# Altium project 01_Riona_Leka_Intro_Task_PCB.PrjPcb
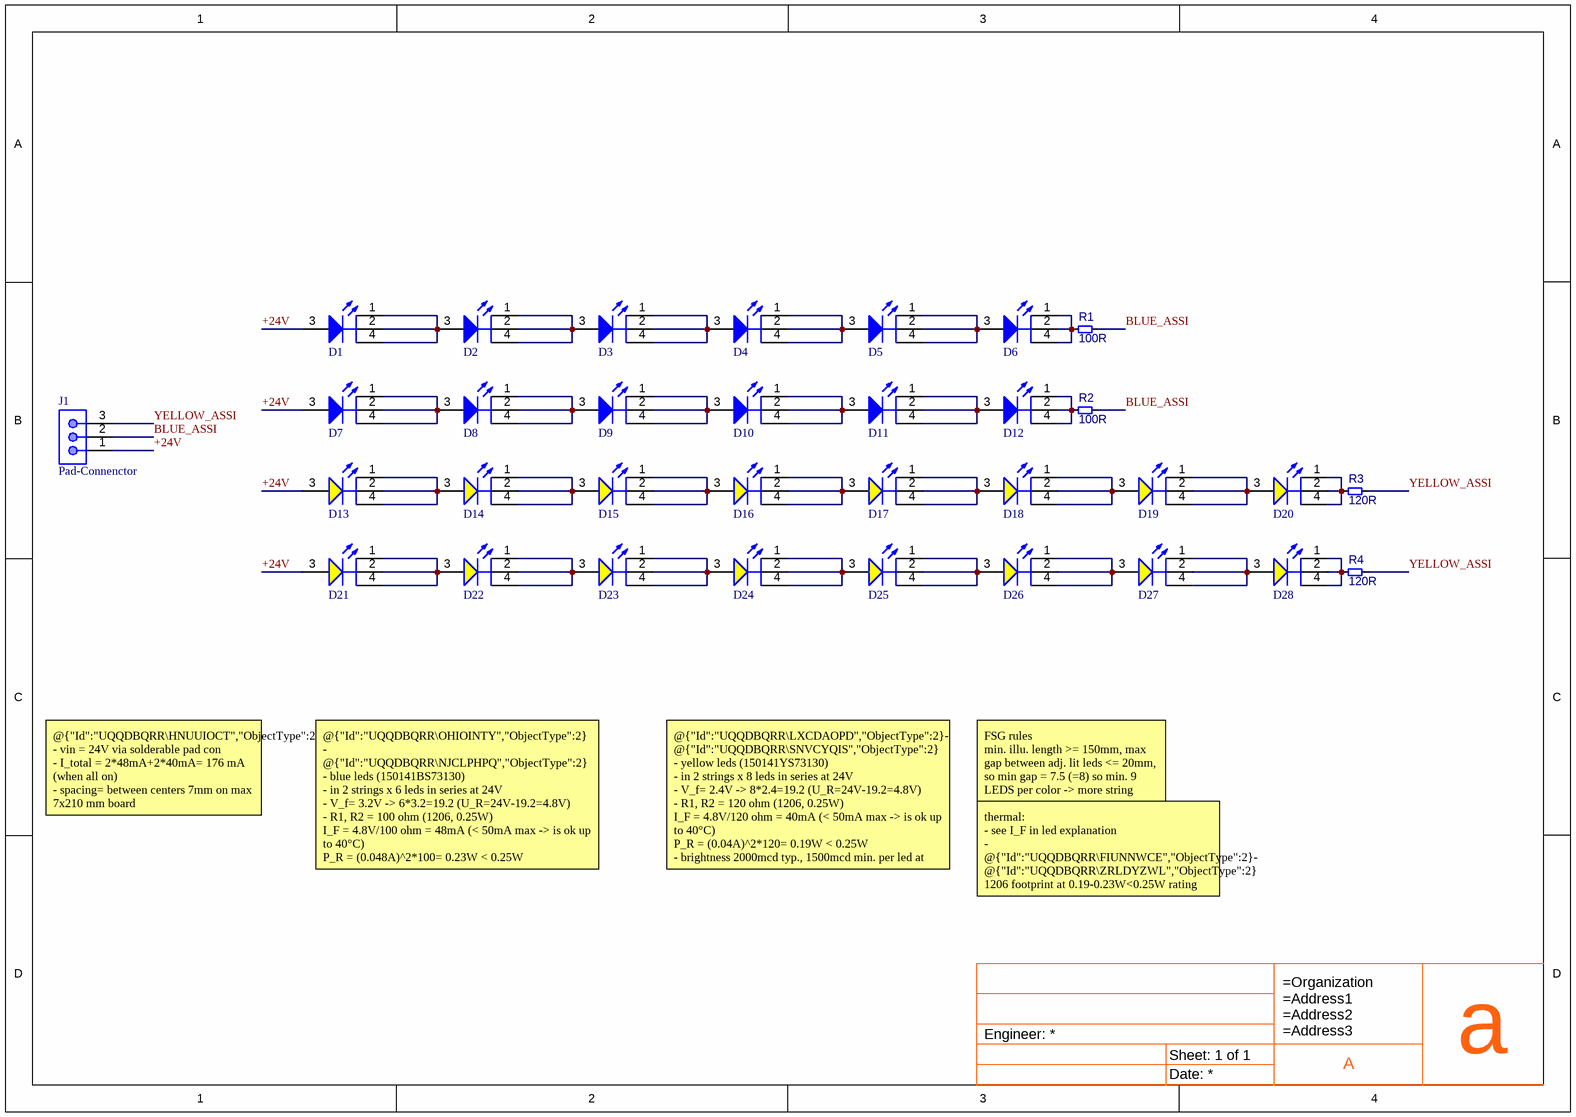
[diagram p0: LED_Strip_RL.SchDoc]
1 sheet, 33 parts. Net scope: global (net labels, ports and power ports of the same name join across sheets).
Board file: LED_Strip_RL.PcbDoc

## Sheet LED_Strip_RL.SchDoc
size 294 x 208 mm; SheetNumber: 1; SheetTotal: 1

### Parts
D1  Blue, 3.2V, 120°  [WL-SMTW_3528_LPCC 4]  (value not drawn)
D2  Blue, 3.2V, 120°  [WL-SMTW_3528_LPCC 4]  (value not drawn)
D3  Blue, 3.2V, 120°  [WL-SMTW_3528_LPCC 4]  (value not drawn)
D4  Blue, 3.2V, 120°  [WL-SMTW_3528_LPCC 4]  (value not drawn)
D5  Blue, 3.2V, 120°  [WL-SMTW_3528_LPCC 4]  (value not drawn)
D6  Blue, 3.2V, 120°  [WL-SMTW_3528_LPCC 4]  (value not drawn)
D7  Blue, 3.2V, 120°  [WL-SMTW_3528_LPCC 4]  (value not drawn)
D8  Blue, 3.2V, 120°  [WL-SMTW_3528_LPCC 4]  (value not drawn)
D9  Blue, 3.2V, 120°  [WL-SMTW_3528_LPCC 4]  (value not drawn)
D10  Blue, 3.2V, 120°  [WL-SMTW_3528_LPCC 4]  (value not drawn)
D11  Blue, 3.2V, 120°  [WL-SMTW_3528_LPCC 4]  (value not drawn)
D12  Blue, 3.2V, 120°  [WL-SMTW_3528_LPCC 4]  (value not drawn)
D13  Yellow, 2.4V, 120°  [WL-SMTW_3528_LPCC 4]  (value not drawn)
D14  Yellow, 2.4V, 120°  [WL-SMTW_3528_LPCC 4]  (value not drawn)
D15  Yellow, 2.4V, 120°  [WL-SMTW_3528_LPCC 4]  (value not drawn)
D16  Yellow, 2.4V, 120°  [WL-SMTW_3528_LPCC 4]  (value not drawn)
D17  Yellow, 2.4V, 120°  [WL-SMTW_3528_LPCC 4]  (value not drawn)
D18  Yellow, 2.4V, 120°  [WL-SMTW_3528_LPCC 4]  (value not drawn)
D19  Yellow, 2.4V, 120°  [WL-SMTW_3528_LPCC 4]  (value not drawn)
D20  Yellow, 2.4V, 120°  [WL-SMTW_3528_LPCC 4]  (value not drawn)
D21  Yellow, 2.4V, 120°  [WL-SMTW_3528_LPCC 4]  (value not drawn)
D22  Yellow, 2.4V, 120°  [WL-SMTW_3528_LPCC 4]  (value not drawn)
D23  Yellow, 2.4V, 120°  [WL-SMTW_3528_LPCC 4]  (value not drawn)
D24  Yellow, 2.4V, 120°  [WL-SMTW_3528_LPCC 4]  (value not drawn)
D25  Yellow, 2.4V, 120°  [WL-SMTW_3528_LPCC 4]  (value not drawn)
D26  Yellow, 2.4V, 120°  [WL-SMTW_3528_LPCC 4]  (value not drawn)
D27  Yellow, 2.4V, 120°  [WL-SMTW_3528_LPCC 4]  (value not drawn)
D28  Yellow, 2.4V, 120°  [WL-SMTW_3528_LPCC 4]  (value not drawn)
J1  Pad-Connenctor  [TSAL-L Connector]
R1  Resistance: 100R  [1206(3216)_L]  (hidden comment: Resistor)
R2  Resistance: 100R  [1206(3216)_L]  (hidden comment: Resistor)
R3  Resistance: 120R  [1206(3216)_L]  (hidden comment: Resistor)
R4  Resistance: 120R  [1206(3216)_L]  (hidden comment: Resistor)

### Nets
+24V: D1.3(A) D7.3(A) D13.3(A) D21.3(A) J1.1
BLUE_ASSI: J1.2 R1.2 R2.2
YELLOW_ASSI: J1.3 R3.2 R4.2
NetD1_1: D1.1(K) D1.2(K) D1.4(K) D2.3(A)
NetD2_1: D2.1(K) D2.2(K) D2.4(K) D3.3(A)
NetD3_1: D3.1(K) D3.2(K) D3.4(K) D4.3(A)
NetD4_1: D4.1(K) D4.2(K) D4.4(K) D5.3(A)
NetD5_1: D5.1(K) D5.2(K) D5.4(K) D6.3(A)
NetD6_1: D6.1(K) D6.2(K) D6.4(K) R1.1
NetD7_1: D7.1(K) D7.2(K) D7.4(K) D8.3(A)
NetD8_1: D8.1(K) D8.2(K) D8.4(K) D9.3(A)
NetD9_1: D9.1(K) D9.2(K) D9.4(K) D10.3(A)
NetD10_1: D10.1(K) D10.2(K) D10.4(K) D11.3(A)
NetD11_1: D11.1(K) D11.2(K) D11.4(K) D12.3(A)
NetD12_1: D12.1(K) D12.2(K) D12.4(K) R2.1
NetD13_1: D13.1(K) D13.2(K) D13.4(K) D14.3(A)
NetD14_1: D14.1(K) D14.2(K) D14.4(K) D15.3(A)
NetD15_1: D15.1(K) D15.2(K) D15.4(K) D16.3(A)
NetD16_1: D16.1(K) D16.2(K) D16.4(K) D17.3(A)
NetD17_1: D17.1(K) D17.2(K) D17.4(K) D18.3(A)
NetD18_1: D18.1(K) D18.2(K) D18.4(K) D19.3(A)
NetD19_1: D19.1(K) D19.2(K) D19.4(K) D20.3(A)
NetD20_1: D20.1(K) D20.2(K) D20.4(K) R3.1
NetD21_1: D21.1(K) D21.2(K) D21.4(K) D22.3(A)
NetD22_1: D22.1(K) D22.2(K) D22.4(K) D23.3(A)
NetD23_1: D23.1(K) D23.2(K) D23.4(K) D24.3(A)
NetD24_1: D24.1(K) D24.2(K) D24.4(K) D25.3(A)
NetD25_1: D25.1(K) D25.2(K) D25.4(K) D26.3(A)
NetD26_1: D26.1(K) D26.2(K) D26.4(K) D27.3(A)
NetD27_1: D27.1(K) D27.2(K) D27.4(K) D28.3(A)
NetD28_1: D28.1(K) D28.2(K) D28.4(K) R4.1

### Notes on the sheet
- FSG rules
  min. illu. length >= 150mm, max gap between adj. lit leds <= 20mm, so min gap = 7.5 (=8) so min. 9 LEDS per color -> more string
- @{"Id":"UQQDBQRR\HNUUIOCT","ObjectType":2}
  - vin = 24V via solderable pad con
  - I_total = 2*48mA+2*40mA= 176 mA (when all on)
  - spacing= between centers 7mm on max 7x210 mm board
- @{"Id":"UQQDBQRR\OHIOINTY","ObjectType":2} - @{"Id":"UQQDBQRR\NJCLPHPQ","ObjectType":2}
  - blue leds (150141BS73130)
  - in 2 strings x 6 leds in series at 24V
  - V_f= 3.2V -> 6*3.2=19.2 (U_R=24V-19.2=4.8V)
  - R1, R2 = 100 ohm (1206, 0.25W)
  I_F = 4.8V/100 ohm = 48mA (< 50mA max -> is ok up to 40°C)
  P_R = (0.048A)^2*100= 0.23W < 0.25W
  - brightness 1000mcd typ., 700mcd min. per led at 50mA so ~960-1000mcd, but 12 leds total so > 1000mcd
- @{"Id":"UQQDBQRR\LXCDAOPD","ObjectType":2}- @{"Id":"UQQDBQRR\SNVCYQIS","ObjectType":2}
  - yellow leds (150141YS73130)
  - in 2 strings x 8 leds in series at 24V
  - V_f= 2.4V -> 8*2.4=19.2 (U_R=24V-19.2=4.8V)
  - R1, R2 = 120 ohm (1206, 0.25W)
  I_F = 4.8V/120 ohm = 40mA (< 50mA max -> is ok up to 40°C)
  P_R = (0.04A)^2*120= 0.19W < 0.25W
  - brightness 2000mcd typ., 1500mcd min. per led at 50mA so ~1600mcd > 1000mcd
- thermal:
  - see I_F in led explanation
  - @{"Id":"UQQDBQRR\FIUNNWCE","ObjectType":2}- @{"Id":"UQQDBQRR\ZRLDYZWL","ObjectType":2} 1206 footprint at 0.19-0.23W<0.25W rating
  brightness: R=(V_sup-V_Led)/I to get R (for blue/yellow) to hit 1000mcd under 50mA
- A
- a

### Library data of the parts
D1-D12 = 150141BS73130: WL-SMTW Mono-color TOP LED Waterclear, size 3528, Blue, 3.2V, 120°; Manufacturer: Wurth Elektronik; Case/Size Code: 3528; Chip Technology: InGaN; Dominant Wavelength: 470nm; Luminous Intensity: 1000mcd; Peak Wavelength: 465nm; Manufacturer Part Number: 150141BS73130; Category: Signal LEDs; Match Code: WL-SMTW; ComponentLink1Description: Website Link; ComponentLink1URL: https://www.we-online.com/redexpert/article/150141BS73130?ad; ComponentLink2Description: Datasheet Link; ComponentLink2URL: https://www.we-online.com/redexpert/spec/150141BS73130?ad; Mount: Surface Mount; Operating Temperature Max: 85°C; Operating Temperature Min: -40°C; Packaging: Tape and Reel; Length: 3.5mm; Width: 2.8mm; Height: 1.85mm; Emitting Color: Blue; Forward Voltage: 3.2V; Viewing Angle: 120°
D13-D28 = 150141YS73130: WL-SMTW Mono-color TOP LED Waterclear, size 3528, Yellow, 2.4V, 120°; Manufacturer: Wurth Elektronik; Case/Size Code: 3528; Chip Technology: AlInGaP; Dominant Wavelength: 590nm; Luminous Intensity: 2000mcd; Peak Wavelength: 592nm; Manufacturer Part Number: 150141YS73130; Category: Signal LEDs; Match Code: WL-SMTW; ComponentLink1Description: Website Link; ComponentLink1URL: https://www.we-online.com/redexpert/article/150141YS73130?ad; ComponentLink2Description: Datasheet Link; ComponentLink2URL: https://www.we-online.com/redexpert/spec/150141YS73130?ad; Mount: Surface Mount; Operating Temperature Max: 85°C; Operating Temperature Min: -40°C; Packaging: Tape and Reel; Length: 3.5mm; Width: 2.8mm; Height: 1.85mm; Emitting Color: Yellow; Forward Voltage: 2.4V; Viewing Angle: 120°
J1 = Pad-Connector: 3 pins. fits the 7mm
R1 R2 = RES-Std: General resistor; Value: 100R; Tolerance: *%; Power (W): *; Manufacturer P/N: *; Current (A): *; Type: *; Voltage (V): *; Manufacturer: *; Capacitance: *
R3 R4 = RES-Std: General resistor; Value: 120R; Tolerance: *%; Power (W): *; Manufacturer P/N: *; Current (A): *; Type: *; Voltage (V): *; Manufacturer: *; Capacitance: *